# Altium schematic sheet 3.dwm3000.SchDoc
size A4; Organization: ORGANIZATION; Address1: ADDRESS 1; Address2: ADDRESS 2; Address3: ADDRESS 3; Address4: ADDRESS 4; DocumentNumber: 4; SheetNumber: 4; SheetTotal: 7; ENG_APP_DATE: --/--/--; DSN_APP_DATE: --/--/--; CHK_APP_DATE: --/--/--; Page: DW3000
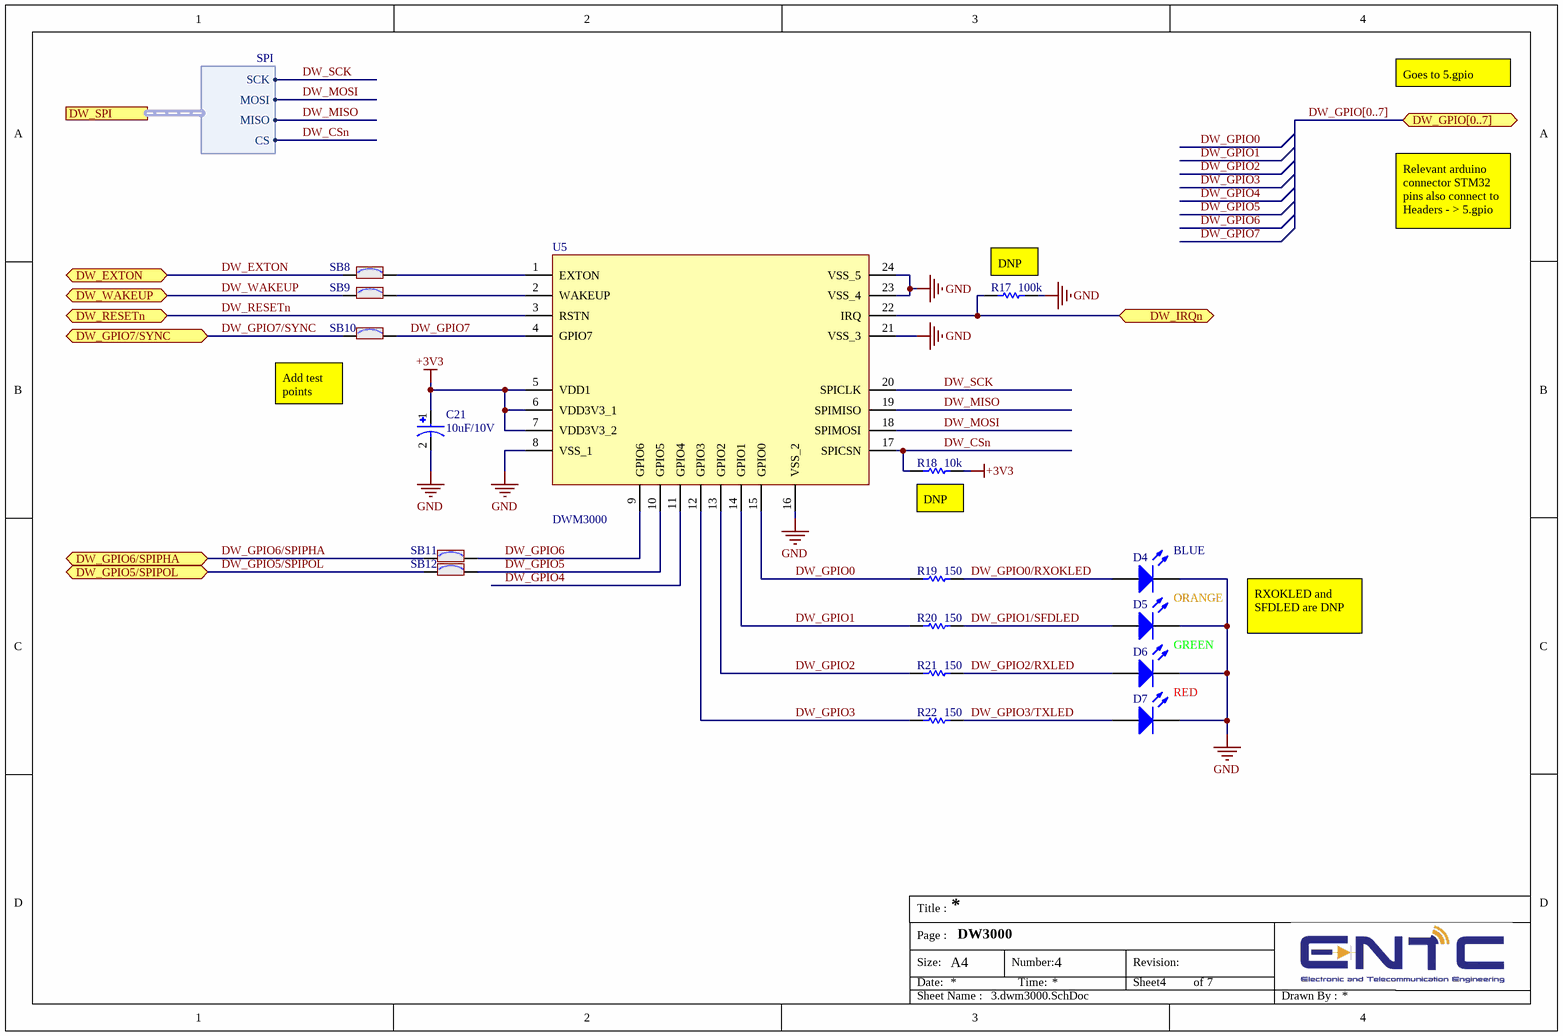
[diagram p0: 3.dwm3000.SchDoc]

## Parts
C21  10uF/10V  [CAP1411]
D4  BLUE  [LED0603]
D5  ORANGE  [LED0603]
D6  GREEN  [LED0603]
D7  RED  [LED0603]
R17  100k  [RES0402]
R18  10k  [RES0402]
R19  150  [RES0402]
R20  150  [RES0402]
R21  150  [RES0402]
R22  150  [RES0402]
SB8  SB_ON  [SOLDER-BRIDGE_R0603-0R]  (value not drawn)
SB9  SB_ON  [SOLDER-BRIDGE_R0603-0R]  (value not drawn)
SB10  SB_ON  [SOLDER-BRIDGE_R0603-0R]  (value not drawn)
SB11  SB_ON  [SOLDER-BRIDGE_R0603-0R]  (value not drawn)
SB12  SB_ON  [SOLDER-BRIDGE_R0603-0R]  (value not drawn)
U5  DWM3000  [DWM3000]

## Ports
DW_EXTON (bidir), DW_GPIO5/SPIPOL (bidir), DW_GPIO6/SPIPHA (bidir), DW_GPIO7/SYNC (bidir), DW_GPIO[0..7] (bidir), DW_IRQn (bidir), DW_RESETn (bidir), DW_SPI (harness SPI), DW_WAKEUP (bidir)

## Harnesses
SPI: CS, MISO, MOSI, SCK

## Nets
+3V3: C21.1 R18.2 U5.5(VDD1) U5.6(VDD3V3_1) U5.7(VDD3V3_2)
GND: C21.2 D4.2(K) D5.2(K) D6.2(K) D7.2(K) R17.1 U5.8(VSS_1) U5.16(VSS_2) U5.21(VSS_3) U5.23(VSS_4) U5.24(VSS_5)
DW_CSn: R18.1 U5.17(SPICSN) ; port DW_SPI.CS
DW_EXTON: SB8.1 ; port DW_EXTON
DW_GPIO0: R19.2 U5.15(GPIO0)
DW_GPIO0/RXOKLED: D4.1(A) R19.1
DW_GPIO1: R20.2 U5.14(GPIO1)
DW_GPIO1/SFDLED: D5.1(A) R20.1
DW_GPIO2: R21.2 U5.13(GPIO2)
DW_GPIO2/RXLED: D6.1(A) R21.1
DW_GPIO3: R22.2 U5.12(GPIO3)
DW_GPIO3/TXLED: D7.1(A) R22.1
DW_GPIO4: U5.11(GPIO4)
DW_GPIO5: SB12.2 U5.10(GPIO5)
DW_GPIO5/SPIPOL: SB12.1 ; port DW_GPIO5/SPIPOL
DW_GPIO6: SB11.2 U5.9(GPIO6)
DW_GPIO6/SPIPHA: SB11.1 ; port DW_GPIO6/SPIPHA
DW_GPIO7: SB10.2 U5.4(GPIO7)
DW_GPIO7/SYNC: SB10.1 ; port DW_GPIO7/SYNC
DW_IRQn: R17.2 U5.22(IRQ) ; port DW_IRQn
DW_MISO: U5.19(SPIMISO) ; port DW_SPI.MISO
DW_MOSI: U5.18(SPIMOSI) ; port DW_SPI.MOSI
DW_RESETn: U5.3(RSTN) ; port DW_RESETn
DW_SCK: U5.20(SPICLK) ; port DW_SPI.SCK
DW_WAKEUP: SB9.1 ; port DW_WAKEUP
NetSB8_2: SB8.2 U5.1(EXTON)
NetSB9_2: SB9.2 U5.2(WAKEUP)

## Buses and harness runs
bus DW_GPIO[0..7] = port DW_GPIO[0..7]

## Notes on the sheet
- Goes to 5.gpio
- Relevant arduino connector STM32 pins also connect to Headers - > 5.gpio
- (near R17) DNP
- (near SB10) Add test points
- (near R18) DNP
- RXOKLED and SFDLED are DNP
- Title :
- Size:
- Date:
- Page :
- A4
- Number:
- Time:
- Revision:
- Sheet
- of
- Sheet Name :
- Drawn By :

## Library data of the parts
C21 = Cap Pol: Polarized capacitor; Manufacturer: *; Manufacturer part number: *; JLCPCB part number: *
D4-D7 = LED: Light Emitting Diode; Manufacturer: *; Manufacturer part number: *; JLCPCB part number: *
R17-R22 = Res: Resistor; Manufacturer: *; Manufacturer part number: *; JLCPCB part number: *
SB8-SB12 = SB_ON: Solder Bridge ON; Internal_Part_Number: MCD-00071; Part_Type: Mechanical; Provided_By: Subcon; Initial_Board_Reference: mb1274; MP: PMR03EZPJ000; ECCN_US: n/a; ECCN_EU: n/a; Status: Released; JLCPCB: C253507
U5 = DWM3000: 6.5 & 8.0 GHz Ultra-Wideband (UWB) Module,Supply voltage: 2.5 to 3.6 V (VDD3V3), 1.62 to 3.6 V (VDD1).; Manufacturer_Name: Qorvo; Geometry.Height: 2.89mm; Manufacturer_Part_Number: DWM3000; Mouser Part Number: N/A; Mouser Price/Stock: https://www.mouser.co.uk/ProductDetail/Qorvo/DWM3000?qs=iLbezkQI%252BsgcUwU6rIS9AQ%3D%3D; Arrow Part Number: *; Arrow Price/Stock: *; Datasheet Link: https://www.qorvo.com/products/p/DWM3000#documents